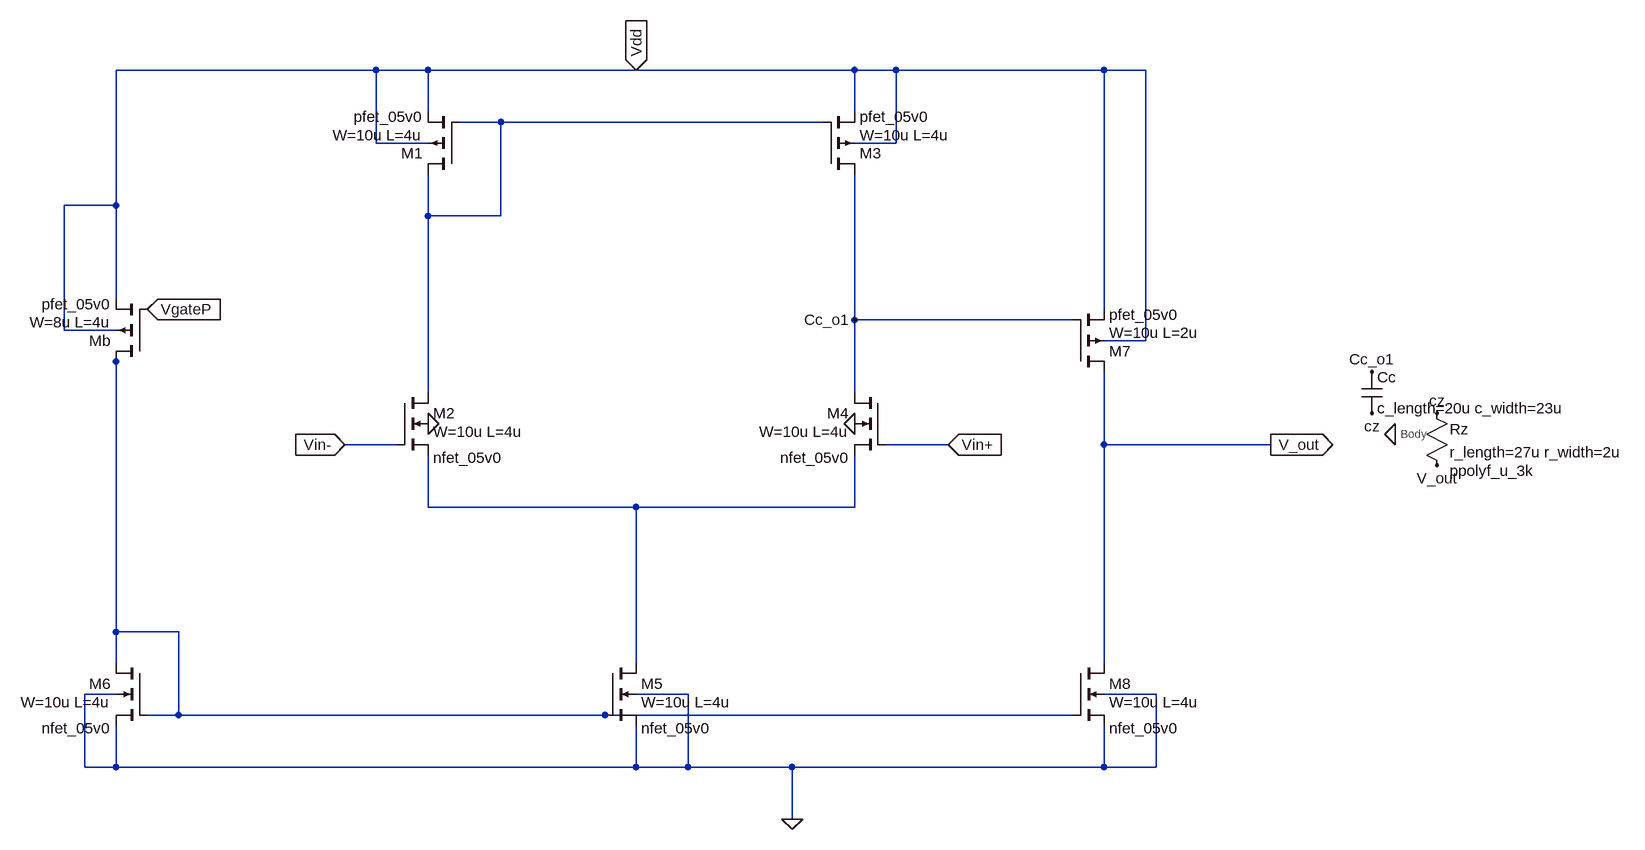
[diagram p0: schematic Dif_opamp.asc]
Dif_opamp.asc, the LTspice schematic file:
Version 4.1
SHEET 1 2168 872
WIRE -16 -464 -416 -464
WIRE 64 -464 -16 -464
WIRE 384 -464 64 -464
WIRE 720 -464 384 -464
WIRE 784 -464 720 -464
WIRE 1104 -464 784 -464
WIRE 1168 -464 1104 -464
WIRE 64 -400 64 -464
WIRE 720 -400 720 -464
WIRE 176 -384 112 -384
WIRE 672 -384 176 -384
WIRE -16 -352 -16 -464
WIRE 64 -352 -16 -352
WIRE 784 -352 784 -464
WIRE 784 -352 720 -352
WIRE -416 -256 -416 -464
WIRE -416 -256 -496 -256
WIRE 64 -240 64 -304
WIRE 176 -240 176 -384
WIRE 176 -240 64 -240
WIRE -416 -112 -416 -256
WIRE 1104 -96 1104 -464
WIRE 720 -80 720 -304
WIRE 1056 -80 720 -80
WIRE -496 -64 -496 -256
WIRE -416 -64 -496 -64
WIRE 1168 -48 1168 -464
WIRE 1168 -48 1104 -48
WIRE -416 -16 -416 -32
WIRE 64 32 64 -240
WIRE 720 32 720 -80
WIRE 16 112 -64 112
WIRE 864 112 768 112
WIRE 1104 112 1104 0
WIRE 1360 112 1104 112
WIRE 64 208 64 128
WIRE 384 208 64 208
WIRE 720 208 720 128
WIRE 720 208 384 208
WIRE -416 400 -416 -16
WIRE -320 400 -416 400
WIRE -416 448 -416 400
WIRE 384 448 384 208
WIRE 1104 448 1104 112
WIRE -416 496 -464 496
WIRE 464 496 384 496
WIRE 1184 496 1104 496
WIRE -320 528 -320 400
WIRE -320 528 -368 528
WIRE 336 528 -320 528
WIRE 1056 528 336 528
WIRE -464 608 -464 496
WIRE -416 608 -416 544
WIRE -416 608 -464 608
WIRE 384 608 384 544
WIRE 384 608 -416 608
WIRE 464 608 464 496
WIRE 464 608 384 608
WIRE 624 608 464 608
WIRE 1104 608 1104 544
WIRE 1104 608 624 608
WIRE 1184 608 1184 496
WIRE 1184 608 1104 608
WIRE 624 688 624 608
FLAG 384 -464 Vdd
IOPIN 384 -464 In
FLAG 624 688 0
FLAG 864 112 Vin+
IOPIN 864 112 In
FLAG -64 112 Vin-
IOPIN -64 112 In
FLAG 1360 112 V_out
IOPIN 1360 112 Out
FLAG -368 -96 VgateP
IOPIN -368 -96 In
FLAG 64 80 0
FLAG 720 80 0
FLAG 720 -80 Cc_o1
FLAG 1516 0 Cc_o1
FLAG 1516 64 cz
FLAG 1616 64 cz
FLAG 1616 144 V_out
FLAG 1552 96 0
SYMBOL pmos4 112 -304 R180
WINDOW 3 56 60 Left 2
WINDOW 38 56 88 Left 2
SYMATTR Value W=10u L=4u
SYMATTR SpiceModel pfet_05v0
SYMATTR InstName M1
SYMATTR Prefix X
SYMBOL nmos4 16 32 R0
WINDOW 3 56 60 Left 2
WINDOW 38 56 100 Left 2
SYMATTR Value W=10u L=4u
SYMATTR SpiceModel nfet_05v0
SYMATTR InstName M2
SYMATTR Prefix X
SYMBOL pmos4 672 -304 M180
WINDOW 3 56 60 Left 2
WINDOW 38 56 88 Left 2
SYMATTR Value W=10u L=4u
SYMATTR SpiceModel pfet_05v0
SYMATTR InstName M3
SYMATTR Prefix X
SYMBOL nmos4 768 32 M0
WINDOW 3 56 60 Left 2
WINDOW 38 56 100 Left 2
SYMATTR Value W=10u L=4u
SYMATTR SpiceModel nfet_05v0
SYMATTR InstName M4
SYMATTR Prefix X
SYMBOL nmos4 336 448 R0
WINDOW 3 56 60 Left 2
WINDOW 38 56 100 Left 2
SYMATTR Value W=10u L=4u
SYMATTR SpiceModel nfet_05v0
SYMATTR InstName M5
SYMATTR Prefix X
SYMBOL nmos4 -368 448 M0
WINDOW 3 56 60 Left 2
WINDOW 38 56 100 Left 2
SYMATTR Value W=10u L=4u
SYMATTR SpiceModel nfet_05v0
SYMATTR InstName M6
SYMATTR Prefix X
SYMBOL pmos4 -368 -16 R180
WINDOW 3 56 60 Left 2
WINDOW 38 56 88 Left 2
SYMATTR Value W=8u L=4u
SYMATTR SpiceModel pfet_05v0
SYMATTR InstName Mb
SYMATTR Prefix X
SYMBOL pmos4 1056 0 M180
WINDOW 3 56 60 Left 2
WINDOW 38 56 88 Left 2
SYMATTR Value W=10u L=2u
SYMATTR SpiceModel pfet_05v0
SYMATTR InstName M7
SYMATTR Prefix X
SYMBOL nmos4 1056 448 R0
WINDOW 3 56 60 Left 2
WINDOW 38 56 100 Left 2
SYMATTR Value W=10u L=4u
SYMATTR SpiceModel nfet_05v0
SYMATTR InstName M8
SYMATTR Prefix X
SYMBOL cap 1500 0 R0
SYMATTR Value c_length=20u c_width=23u
SYMATTR SpiceModel cap_nmos_06v0
SYMATTR InstName Cc
SYMATTR Prefix X
SYMBOL res3 1600 48 R0
WINDOW 38 36 104 Left 2
SYMATTR SpiceModel ppolyf_u_3k
SYMATTR InstName Rz
SYMATTR Value r_length=27u r_width=2u

The netlist it stands for:
* Dif_opamp.asc
X§M1 N001 N001 Vdd Vdd pfet_05v0 W=10u L=4u  ; pins D G S B
X§M2 N001 Vin- N003 0 nfet_05v0 W=10u L=4u  ; pins D G S B
X§M3 Cc_o1 N001 Vdd Vdd pfet_05v0 W=10u L=4u  ; pins D G S B
X§M4 Cc_o1 Vin+ N003 0 nfet_05v0 W=10u L=4u  ; pins D G S B
X§M5 N003 N002 0 0 nfet_05v0 W=10u L=4u  ; pins D G S B
X§M6 N002 N002 0 0 nfet_05v0 W=10u L=4u  ; pins D G S B
X§Mb N002 VgateP Vdd Vdd pfet_05v0 W=8u L=4u  ; pins D G S B
X§M7 V_out Cc_o1 Vdd Vdd pfet_05v0 W=10u L=2u  ; pins D G S B
X§M8 V_out N002 0 0 nfet_05v0 W=10u L=4u  ; pins D G S B
X§Cc Cc_o1 cz cap_nmos_06v0 c_length=20u c_width=23u  ; pins A B
X§Rz cz V_out 0 ppolyf_u_3k r_length=27u r_width=2u  ; pins A B Body
.backanno
.end